# Altium schematic sheet 核心板.SchDoc
size A3; Organization: Altium Limited; Address1: L3, 12a Rodborough Rd; Address2: Frenchs Forest; Address3: NSW; Address4: Australia 2086
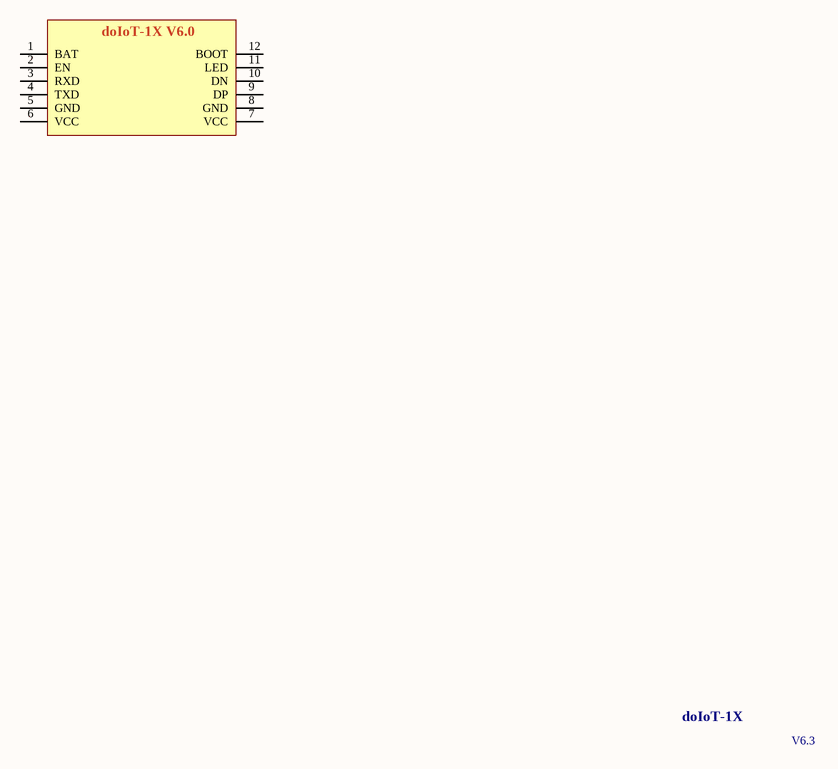
[diagram p0: 核心板.SchDoc]

## Parts
P?  doIoT-1X V6.0  [doIoT-1X V6.0]  (value not drawn)

## Nets

Not connected (* = marked no-connect by the designer): P? 1(BAT) 2(EN) 3(RXD) 4(TXD) 5(GND) 6(VCC) 7(VCC) 8(GND) 9(DP) 10(DN) 11(LED) 12(BOOT)

## Notes on the sheet
- doIoT-1X
- V6.3
- Title:
- Size:
- A3
- Revision:
- 成都度云未来科技有限公司
- Chengdu  Doiot  Technology  Co.,LTD
- Date:
- By:
- Aaron ZYF
- www.domall.cn <n>